# Altium schematic sheet Power.SchDoc
size A4; SheetNumber: 3; SheetTotal: 5
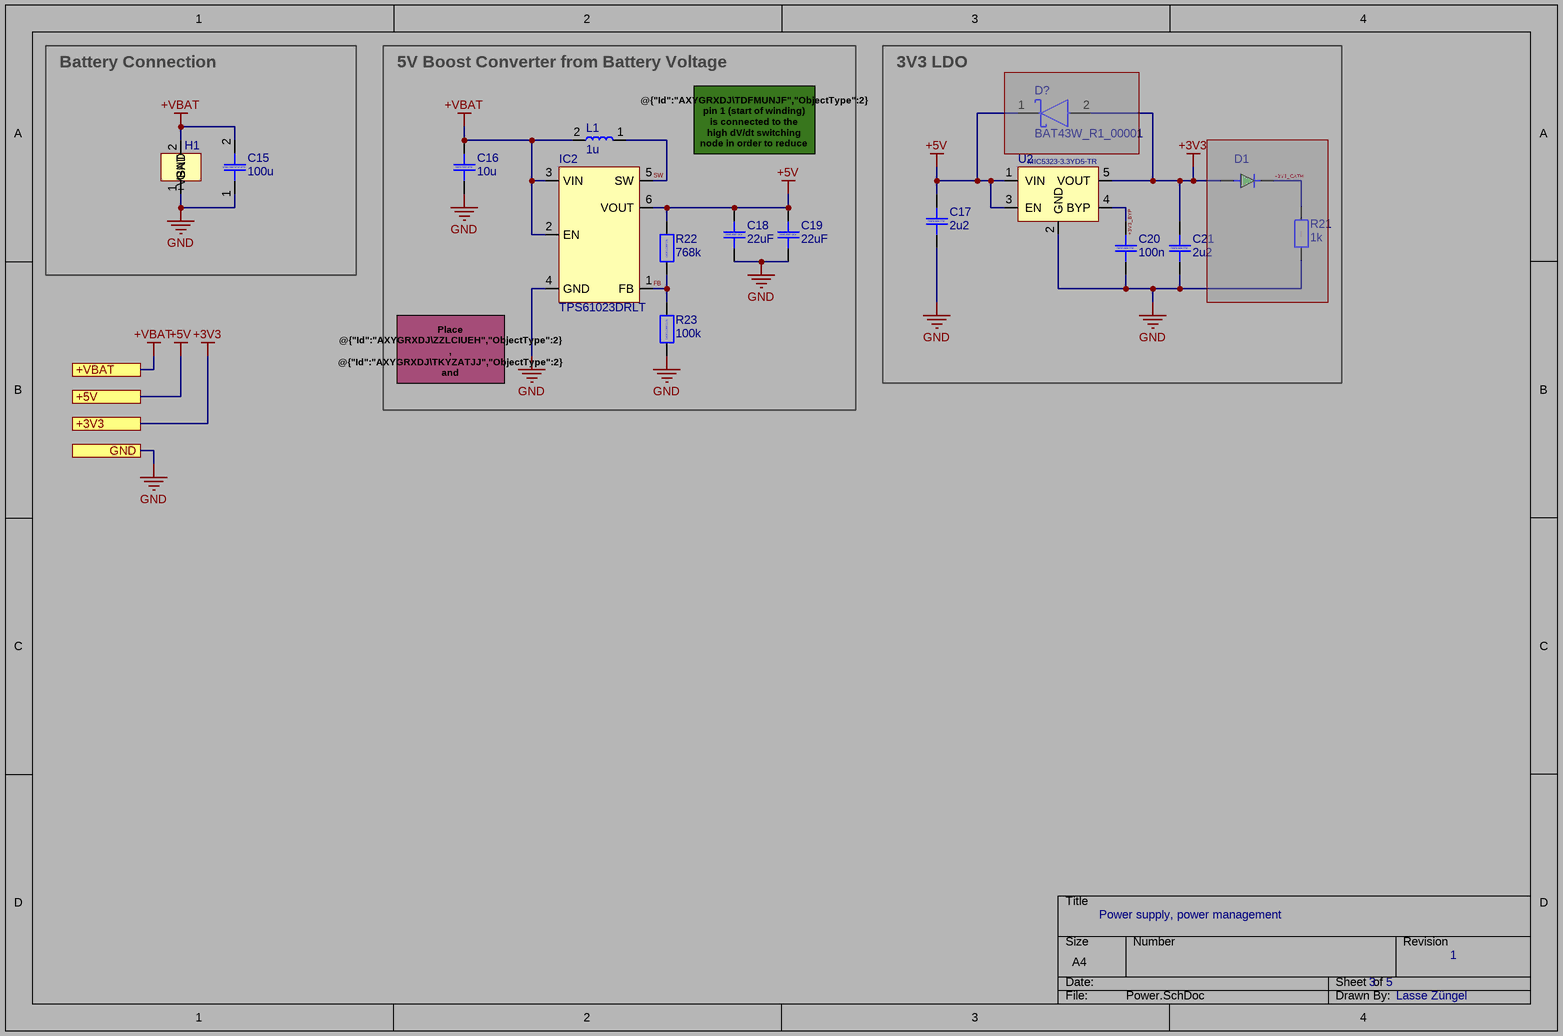
[diagram p0: Power.SchDoc]

## Parts
C15  100u  [CAP_1210]
C16  10u  [CAP_0805s]
C17  2u2  [CAP_0603_L]
C18  22uF  [CAP_0805s]
C19  22uF  [CAP_0805s]
C20  100n  [CAP_0402]
C21  2u2  [CAP_0603_L]
D1  SMD_LED_0603  [SMD_LED_0603]  (value not drawn)  (masked out: inside a compile mask, not in the netlist)
D?  BAT43W_R1_00001  [SOD123]  (masked out: inside a compile mask, not in the netlist)
H1  BatteryWireSoldering  [BatteryWireSoldering]  (value not drawn)
IC2  TPS61023DRLT  [SOTFL50P160X60-6N]
L1  1u  [74438357010]
R21  1k  [RES_0603]  (masked out: inside a compile mask, not in the netlist)
R22  768k  [RES_0402]
R23  100k  [RES_0402]
U2  MIC5323-3.3YD5-TR  [SPX3819M5-L-3-3/TR]

## Blocks framed on the sheet
Battery Connection: C15 H1
5V Boost Converter from Battery Voltage: C16 C18 C19 IC2 L1 R22 R23
3V3 LDO: C17 C20 C21 D1 D? R21 U2

## Ports
+3V3 (see Main[2B], Interfacing[1A], MotorDriverChannel[2C]), +5V (see Main[2B], Interfacing[1A], MotorDriverChannel[2C]), +VBAT (see Main[2B], Interfacing[2B], MotorDriverChannel[2C]), GND (see Main[2B], Interfacing[1A], MotorDriverChannel[2C])

## Nets
+3V3: C21.2 U2.5(VOUT) ; port +3V3
+5V: C17.2 C18.2 C19.2 IC2.6(VOUT) R22.2 U2.1(VIN) U2.3(EN) ; port +5V
+VBAT: C15.2(-) C16.2 H1.2(+VBAT) IC2.2(EN) IC2.3(VIN) L1.2 ; port +VBAT
GND: C15.1(+) C16.1 C17.1 C18.1 C19.1 C20.1 C21.1 H1.1(GND) IC2.4(GND) R23.1 U2.2(GND) ; port GND
+3V3_BYP: C20.2 U2.4(BYP)
FB: IC2.1(FB) R22.1 R23.2
SW: IC2.5(SW) L1.1

## Notes on the sheet
- @{"Id":"AXYGRXDJ\TDFMUNJF","ObjectType":2} pin 1 (start of winding) is connected to the high dV/dt switching node in order to reduce EMI.
- Place @{"Id":"AXYGRXDJ\ZZLCIUEH","ObjectType":2} , @{"Id":"AXYGRXDJ\TKYZATJJ","ObjectType":2} and @{"Id":"AXYGRXDJ\BTTPASSS","ObjectType":2} very close to the respective pins. Keep the loop areas small!
- Power supply, power management
- 3   5
- 1
- Lasse Züngel
- (in symbol AC0402FR-07768KL) 0402 1/16W 1%
- (in symbol AE0402BR-07100KL) 0402 1/16W 0.1%
- (in symbol CAP_0402_X5R_25V) 0402 X5R 25V
- (in symbol CAP_0603_X5R_25V) 0603 X5R 25V
- (in symbol GXT21BR61C226ME13L) 0805 X5R 16V
- (in symbol MCAST21GBB5106KTNA01) 0805 X5R 25V
- (in symbol MSASE32MAB5107MPNA01) 100u 16V 1210 20%
- (in symbol RES_0603) 0603

## Library data of the parts
C15 = MSASE32MAB5107MPNA01: Multilayer Ceramic Capacitors MLCC - SMD/SMT 16V 100uF X5R 1210 20 %; Manufacturer_Name: TAIYO YUDEN; Datasheet Link: https://www.mouser.com/catalog/specsheets/Tayio_Yuden_1102023_MS_mlcc_all_e.pdf?_gl=1*1rxg4sj*_gcl_aw*R0NMLjE3ODg0ODY5MTcuQ2p3S0NBand3SnpQQmhCUkVpd0FKZkhSblM5ekZUOGFxTzJkNFhkWjRHZDBxQk1uWEFQeTNmZmF0eVh2MzN0WXVpZGxzbWlweWtiRWR4b0NrX3NRQXZEX0J3RQ..*_gcl_au*MTk2MDIwMzcyMS4xNzg3MTYzOTg5LjE1NDU2MTg1LjE3ODgzMTM3ODEuMTc4ODMxMzc4Ny4zOTIwMDAxODQuMTc4ODMxMzc4MS4xNzg4MzEzNzg3*_ga*NTU1NDc1MzkuMTc2MzAwODA1OQ..*_ga_15W4STQT4T*czE3ODg4NzY3NDUkbzIxNiRnMCR0MTc4ODg3ODI1NSRqNjAkbDAkaDA.; Height: 2.5mm; Manufacturer_Part_Number: MSASE32MAB5107MPNA01; Mouser Part Number: 963-MSASE32MAB5107MP; Mouser Price/Stock: https://www.mouser.co.uk/ProductDetail/Wurth-Elektronik/865080343009?qs=0KOYDY2FL28Gid9q%2FqirTQ%3D%3D
C16 = MCAST21GBB5106KTNA01: Multilayer Ceramic Capacitors MLCC - SMD/SMT 25V 10uF X5R 0805 10%; Manufacturer_Name: TAIYO YUDEN; Datasheet Link: https://www.mouser.com/catalog/specsheets/Taiyo%20Yuden_1102023_MC_mlcc_all_e.pdf; Manufacturer_Part_Number: MCAST21GBB5106KTNA01
C17 C21 = CAP_0603_X5R_25V: Capacitor 0603 generic, X5R, 25V
C18 C19 = GXT21BR61C226ME13L: Multilayer Ceramic Capacitors MLCC - SMD/SMT 0805 16VDC 22uF 20% X5R AEC-Q200; Manufacturer_Name: Murata Electronics; Datasheet Link: https://www.mouser.de/datasheet/3/76/4/GXT21BR61C226ME13_01A.pdf; Manufacturer_Part_Number: GXT21BR61C226ME13L
C20 = CAP_0402_X5R_25V: Capacitor 0402 generic, X5R, 25V
D? = BAT43W_R1_00001: Schottky Diodes & Rectifiers 30V,Schottky,SOD-123,0.2A; Supplier Part Number 1: 3757-BAT43W_R1_00001CT-ND; Supplier 1: Digikey
H1 = BatteryWireSoldering: Manual soldering pads (TH), for BT2.0 pigtails using 22awg silicone wiring
IC2 = TPS61023DRLT: Switching Voltage Regulators 3.7-A boost converte r with 0.5-V ultra- A 595-TPS61023DRLR; Manufacturer_Name: Texas Instruments; Datasheet Link: http://www.ti.com/general/docs/suppproductinfo.tsp?distId=10&gotoUrl=http%3A%2F%2Fwww.ti.com%2Flit%2Fgpn%2Ftps61023; Height: 0.6mm; Manufacturer_Part_Number: TPS61023DRLT; Mouser Part Number: 595-TPS61023DRLT; Mouser Price/Stock: https://www.mouser.co.uk/ProductDetail/Texas-Instruments/TPS61023DRLT?qs=BJlw7L4Cy78Zr3IJIU3gNw%3D%3D; Arrow Part Number: TPS61023DRLT; Arrow Price/Stock: https://www.arrow.com/en/products/tps61023drlt/texas-instruments.html?utm_currency=USD&region=nac
L1 = 74438357010: Power Inductors - SMD WE-MAPI 1uH 7.4A DCR=13.5mOhms AEC-Q200; Manufacturer_Name: Wurth Elektronik; Datasheet Link: https://www.we-online.com/catalog/datasheet/74438357010.pdf; Height: 3.1mm; Manufacturer_Part_Number: 74438357010; Mouser Part Number: 710-74438357010; Mouser Price/Stock: https://www.mouser.co.uk/ProductDetail/Wurth-Elektronik/74438357010?qs=AQlKX63v8RstGPuQmrueWg%3D%3D; Arrow Part Number: 74438357010; Arrow Price/Stock: null?utm_currency=USD&region=asia
R21 = RES_0603: Resistor 0603 generic
R22 = AC0402FR-07768KL: Thick Film Resistors - SMD 768 kOhms 1/16 W 50 V 1 % 0402 100 PPM / C - 55 C / + 155 C AEC-Q200; Manufacturer_Name: YAGEO; Datasheet Link: https://www.mouser.de/datasheet/3/508/1/PYu-AC_51_RoHS_L_11.pdf; Manufacturer_Part_Number: AC0402FR-07768KL
R23 = AE0402BR-07100KL: Thick Film Resistors - SMD 100KOhm 0402 1/3W 0.1% Hal Free AEC-Q200; Manufacturer_Name: YAGEO; Datasheet Link: https://yageogroup.com/content/datasheet/asset/file/PYU-AE_51_ROHS_L; Manufacturer_Part_Number: AE0402BR-07100KL
U2 = MIC5323-3.3YD5-TR: LDO Voltage Regulators 300mA uCap ULDO High PSRR Low Noise Regulator; Manufacturer_Name: Microchip Technology; Manufacturer_Part_Number: MIC5323-3.3YD5-TR; Datasheet Link: https://www.mouser.de/datasheet/3/282/1/MIC5323.pdf